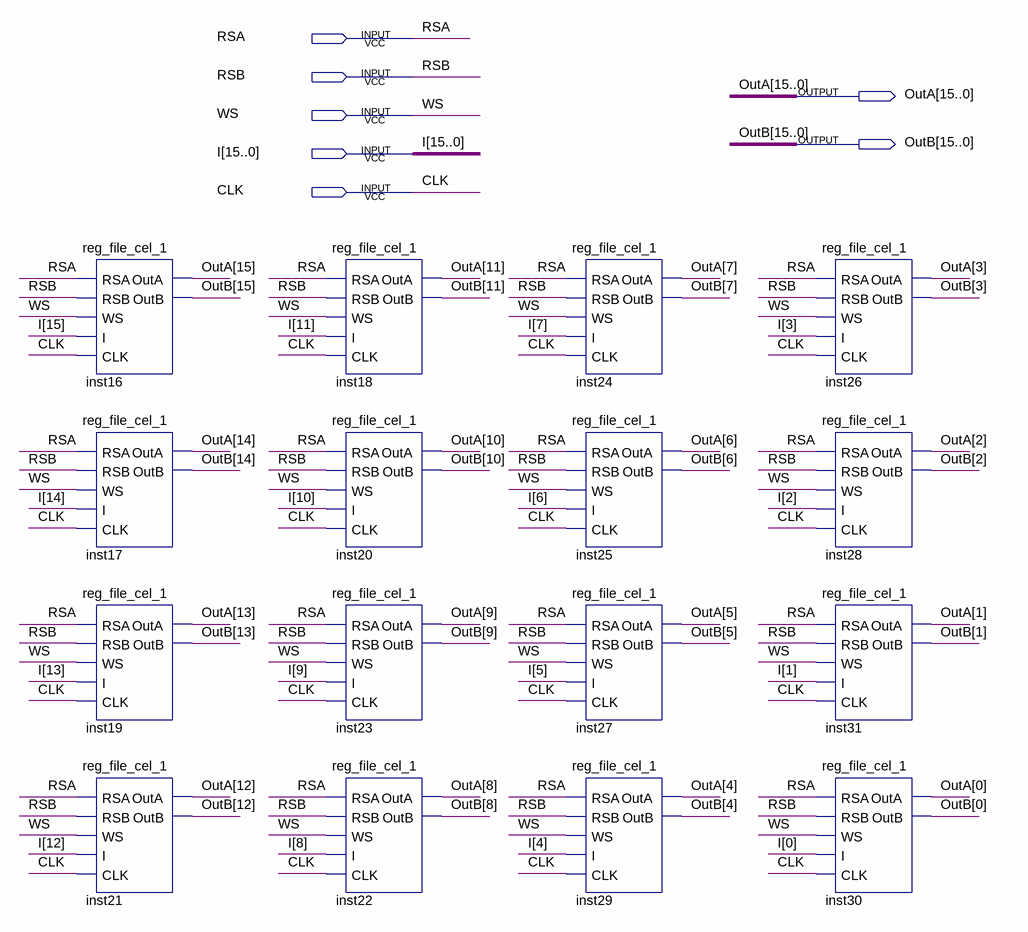
[diagram p0: schematic sheet]
// Quartus schematic reg_file_cell_16bit.bdf as structural Verilog: 16 symbols, 7 pins
module reg_file_cell_16bit (
  input  RSA,
  input  RSB,
  input  WS,
  input  [15:0] I,
  input  CLK,
  output [15:0] OutA,
  output [15:0] OutB
);

  reg_file_cel_1 inst16 (.RSA(RSA), .RSB(RSB), .WS(WS), .I(I[15]), .CLK(CLK), .OutA(OutA[15]), .OutB(OutB[15]));
  reg_file_cel_1 inst17 (.RSA(RSA), .RSB(RSB), .WS(WS), .I(I[14]), .CLK(CLK), .OutA(OutA[14]), .OutB(OutB[14]));
  reg_file_cel_1 inst19 (.RSA(RSA), .RSB(RSB), .WS(WS), .I(I[13]), .CLK(CLK), .OutA(OutA[13]), .OutB(OutB[13]));
  reg_file_cel_1 inst21 (.RSA(RSA), .RSB(RSB), .WS(WS), .I(I[12]), .CLK(CLK), .OutA(OutA[12]), .OutB(OutB[12]));
  reg_file_cel_1 inst18 (.RSA(RSA), .RSB(RSB), .WS(WS), .I(I[11]), .CLK(CLK), .OutA(OutA[11]), .OutB(OutB[11]));
  reg_file_cel_1 inst20 (.RSA(RSA), .RSB(RSB), .WS(WS), .I(I[10]), .CLK(CLK), .OutA(OutA[10]), .OutB(OutB[10]));
  reg_file_cel_1 inst23 (.RSA(RSA), .RSB(RSB), .WS(WS), .I(I[9]), .CLK(CLK), .OutA(OutA[9]), .OutB(OutB[9]));
  reg_file_cel_1 inst22 (.RSA(RSA), .RSB(RSB), .WS(WS), .I(I[8]), .CLK(CLK), .OutA(OutA[8]), .OutB(OutB[8]));
  reg_file_cel_1 inst24 (.RSA(RSA), .RSB(RSB), .WS(WS), .I(I[7]), .CLK(CLK), .OutA(OutA[7]), .OutB(OutB[7]));
  reg_file_cel_1 inst25 (.RSA(RSA), .RSB(RSB), .WS(WS), .I(I[6]), .CLK(CLK), .OutA(OutA[6]), .OutB(OutB[6]));
  reg_file_cel_1 inst27 (.RSA(RSA), .RSB(RSB), .WS(WS), .I(I[5]), .CLK(CLK), .OutA(OutA[5]), .OutB(OutB[5]));
  reg_file_cel_1 inst29 (.RSA(RSA), .RSB(RSB), .WS(WS), .I(I[4]), .CLK(CLK), .OutA(OutA[4]), .OutB(OutB[4]));
  reg_file_cel_1 inst26 (.RSA(RSA), .RSB(RSB), .WS(WS), .I(I[3]), .CLK(CLK), .OutA(OutA[3]), .OutB(OutB[3]));
  reg_file_cel_1 inst28 (.RSA(RSA), .RSB(RSB), .WS(WS), .I(I[2]), .CLK(CLK), .OutA(OutA[2]), .OutB(OutB[2]));
  reg_file_cel_1 inst31 (.RSA(RSA), .RSB(RSB), .WS(WS), .I(I[1]), .CLK(CLK), .OutA(OutA[1]), .OutB(OutB[1]));
  reg_file_cel_1 inst30 (.RSA(RSA), .RSB(RSB), .WS(WS), .I(I[0]), .CLK(CLK), .OutA(OutA[0]), .OutB(OutB[0]));
endmodule
